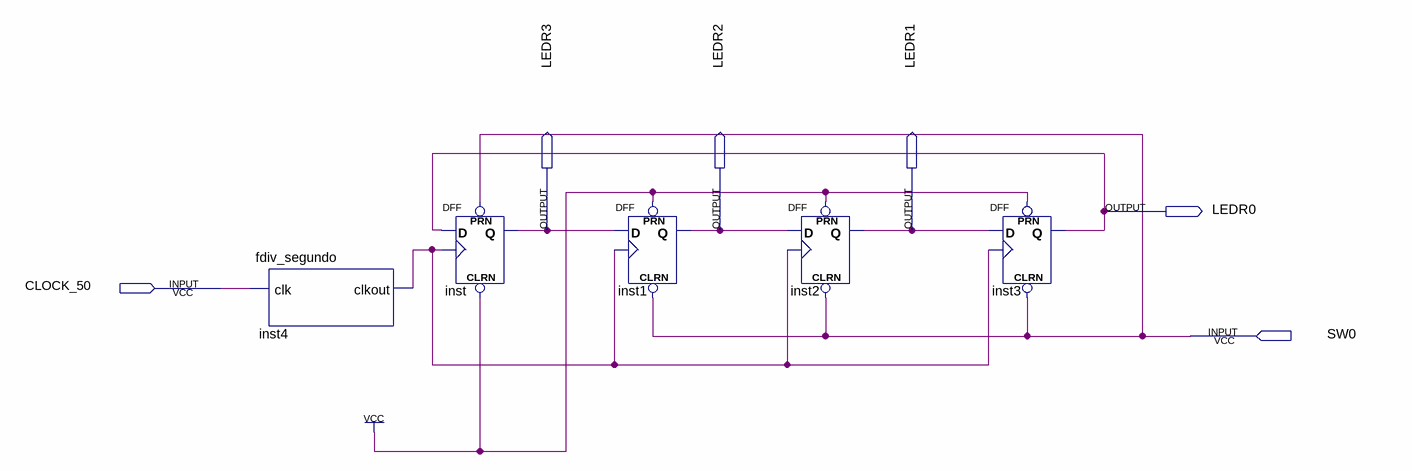
[diagram p0: schematic sheet]
// Quartus schematic experimento23.bdf as structural Verilog: 5 symbols, 6 pins
module experimento23 (
  input  CLOCK_50,
  input  SW0,
  output LEDR0,
  output LEDR3,
  output LEDR2,
  output LEDR1
);

  wire inst4_clkout;

  fdiv_segundo inst4 (.clk(CLOCK_50), .clkout(inst4_clkout));
  DFF inst (.CLRN(1'b1), .CLK(inst4_clkout), .D(LEDR0), .PRN(SW0), .Q(LEDR3));
  DFF inst1 (.CLRN(SW0), .CLK(inst4_clkout), .D(LEDR3), .PRN(1'b1), .Q(LEDR2));
  DFF inst2 (.CLRN(SW0), .CLK(inst4_clkout), .D(LEDR2), .PRN(1'b1), .Q(LEDR1));
  DFF inst3 (.CLRN(SW0), .CLK(inst4_clkout), .D(LEDR1), .PRN(1'b1), .Q(LEDR0));
endmodule
